# Altium project projeto_ana_exmachina.PrjPcb
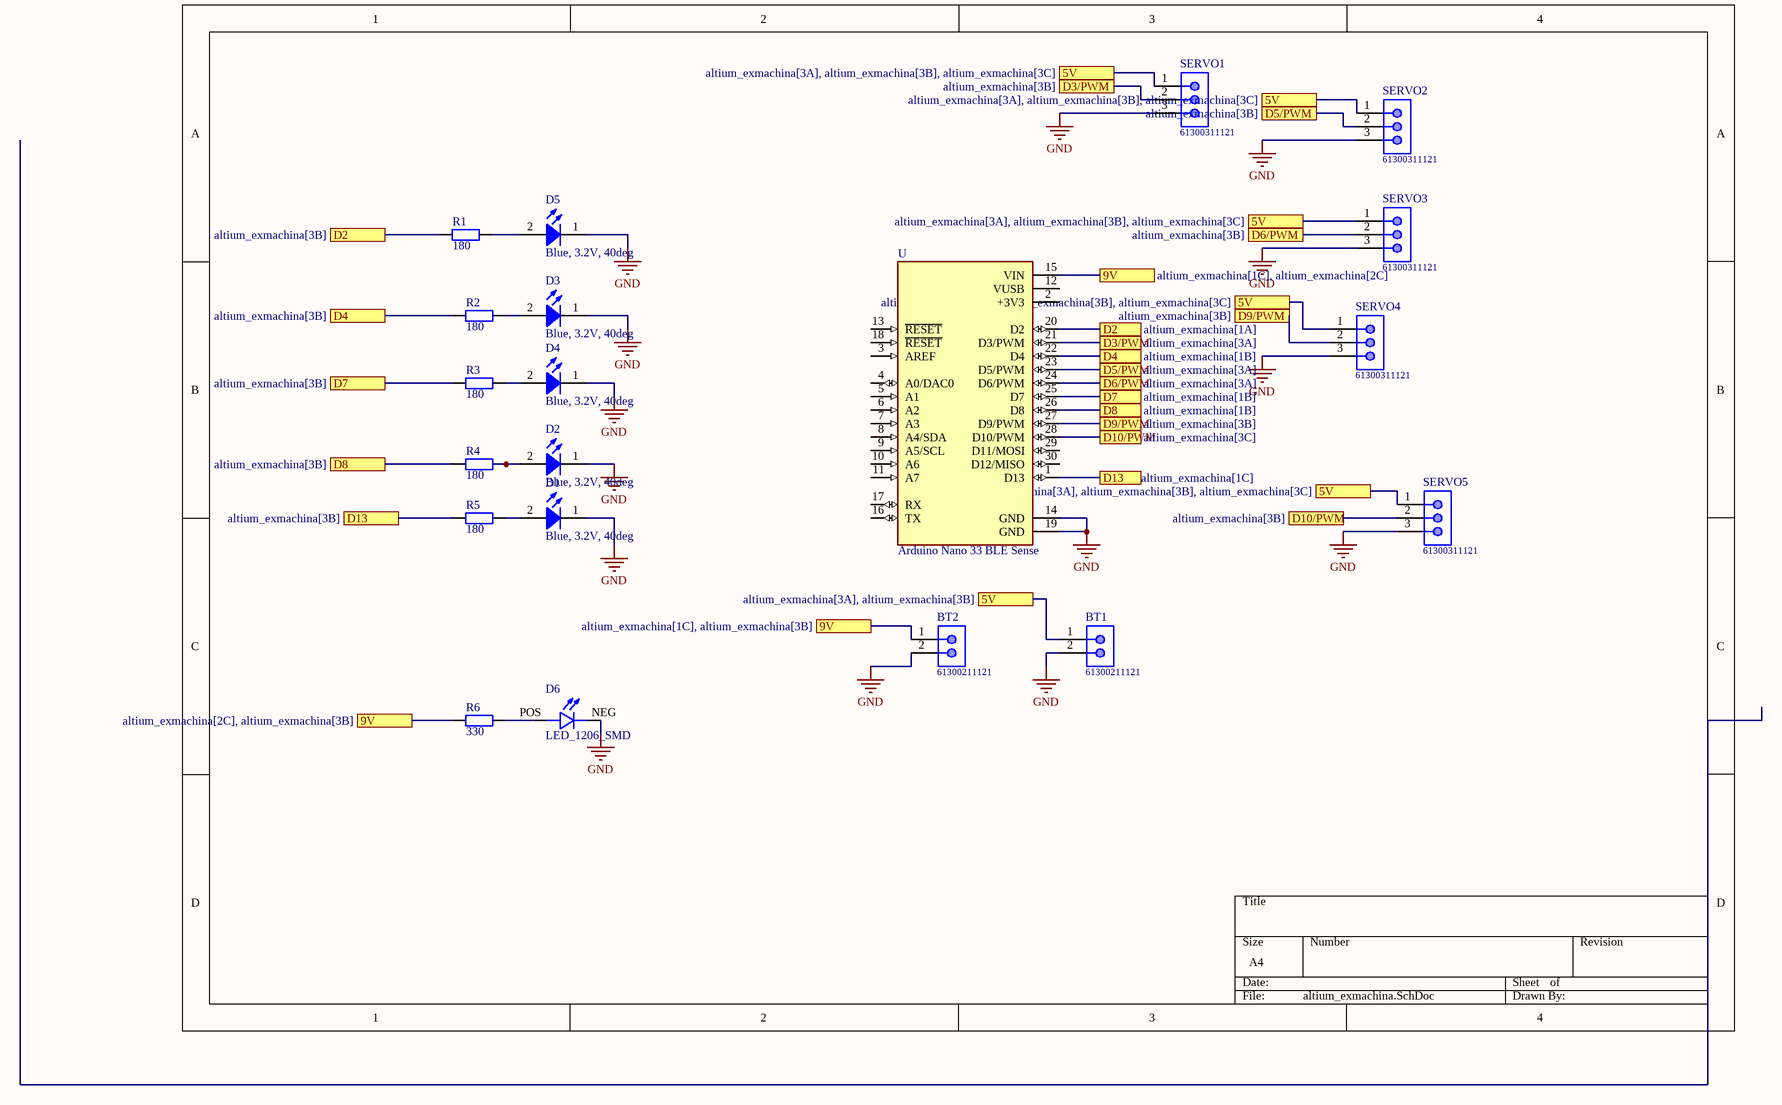
[diagram p0: altium_exmachina.SchDoc]
1 sheet, 20 parts. Net scope: flat (ports and power ports of the same name join across sheets).
Board file: pcbaltium_exmachina.PcbDoc

## Sheet altium_exmachina.SchDoc
size A4; SheetNumber: 1; SheetTotal: 1

### Parts
BT1  61300211121  [61300211121]
BT2  61300211121  [61300211121]
D1  Blue, 3.2V, 40deg  [LED Blue 3mm]
D2  Blue, 3.2V, 40deg  [LED Blue 3mm]
D3  Blue, 3.2V, 40deg  [LED Blue 3mm]
D4  Blue, 3.2V, 40deg  [LED Blue 3mm]
D5  Blue, 3.2V, 40deg  [LED Blue 3mm]
D6  LED_1206_SMD  [LEDC3216X120N]
R1  value 180  [RES AXIAL-0.4]  (hidden comment: Res)
R2  value 180  [RES AXIAL-0.4]  (hidden comment: Res)
R3  value 180  [RES AXIAL-0.4]  (hidden comment: Res)
R4  value 180  [RES AXIAL-0.4]  (hidden comment: Res)
R5  value 180  [RES AXIAL-0.4]  (hidden comment: Res)
R6  value 330  [RES AXIAL-0.4]  (hidden comment: Res)
SERVO1  61300311121  [61300311121]
SERVO2  61300311121  [61300311121]
SERVO3  61300311121  [61300311121]
SERVO4  61300311121  [61300311121]
SERVO5  61300311121  [61300311121]
U  Arduino Nano 33 BLE Sense  [MODULE_ABX00027]

### Ports
5V (see altium_exmachina[3A], altium_exmachina[3B]), 5V (see altium_exmachina[3A], altium_exmachina[3B], altium_exmachina[3C]), 9V (see altium_exmachina[1C], altium_exmachina[2C]), 9V (see altium_exmachina[1C], altium_exmachina[3B]), 9V (see altium_exmachina[2C], altium_exmachina[3B]), D2 (see altium_exmachina[1A]), D2 (see altium_exmachina[3B]), D3/PWM (see altium_exmachina[3A]), D3/PWM (see altium_exmachina[3B]), D4 (see altium_exmachina[1B]), D4 (see altium_exmachina[3B]), D5/PWM (see altium_exmachina[3A]), D5/PWM (see altium_exmachina[3B]), D6/PWM (see altium_exmachina[3A]), D6/PWM (see altium_exmachina[3B]), D7 (see altium_exmachina[1B]), D7 (see altium_exmachina[3B]), D8 (see altium_exmachina[1B]), D8 (see altium_exmachina[3B]), D9/PWM (see altium_exmachina[3B]), D10/PWM (see altium_exmachina[3B]), D10/PWM (see altium_exmachina[3C]), D13 (see altium_exmachina[1C]), D13 (see altium_exmachina[3B])

### Nets
GND: BT1.2 BT2.2 D1.1(K) D2.1(K) D3.1(K) D4.1(K) D5.1(K) D6.NEG SERVO1.3 SERVO2.3 SERVO3.3 SERVO4.3 SERVO5.3 U.14(GND) U.19(GND)
NetBT1_1: BT1.1 SERVO1.1 SERVO2.1 SERVO3.1 SERVO4.1 SERVO5.1 ; port 5V
NetBT2_1: BT2.1 R6.1 U.15(VIN) ; port 9V
NetD1_2: D1.2(A) R5.2
NetD2_2: D2.2(A) R4.2
NetD3_2: D3.2(A) R2.2
NetD4_2: D4.2(A) R3.2
NetD5_2: D5.2(A) R1.2
NetD6_POS: D6.POS R6.2
NetR1_1: R1.1 U.20(D2) ; port D2
NetR2_1: R2.1 U.22(D4) ; port D4
NetR3_1: R3.1 U.25(D7) ; port D7
NetR4_1: R4.1 U.26(D8) ; port D8
NetR5_1: R5.1 U.1(D13) ; port D13
NetSERVO1_2: SERVO1.2 U.21(D3/PWM) ; port D3/PWM
NetSERVO2_2: SERVO2.2 U.23(D5/PWM) ; port D5/PWM
NetSERVO3_2: SERVO3.2 U.24(D6/PWM) ; port D6/PWM
NetSERVO4_2: SERVO4.2 U.27(D9/PWM) ; port D9/PWM
NetSERVO5_2: SERVO5.2 U.28(D10/PWM) ; port D10/PWM

Not connected (* = marked no-connect by the designer): U 2(+3V3) 3(AREF) 4(A0/DAC0) 5(A1) 6(A2) 7(A3) 8(A4/SDA) 9(A5/SCL) 10(A6) 11(A7) 12(VUSB) 13(~{RESET}) 16(TX) 17(RX) 18(~{RESET}) 29(D11/MOSI) 30(D12/MISO)

### Library data of the parts
BT1 BT2 = 61300211121: WR-PHD Pin Header, THT, pitch 2.54mm, Single Row, Vertical, 2pin; Pin Number: 2; Gender: Male; Rated Current: 3A; Working Voltage: 250VAC; Withstanding Voltage: 500VAC; Contact Resistance: 20mOhm; ComponentLink1Description: Manufacturer; ComponentLink1URL: http://www.we-online.de; ComponentLink2Description: Datasheet; ComponentLink2URL: https://katalog.we-online.de/em/datasheet/6130xx11121.pdf; Part Number: 61300211121; Published Date: June 2019; Publisher: Wurth Elektronik; Pitch: 2.54mm; Operating Temperature: -40 to +105degC; Mounting Technology: THT; Packaging: Bag; Row Number: Single; Orientation: Vertical
D1-D5 = LED: LED WL-TMRC THT Mono-color Round; Part Number: 151051BS04000; Luminous Intensity: 500mcd; Dominant Wavelength: 470nm; Peak Wavelength: 465nm; Chip Technology: GaN; ComponentLink1Description: Manufacturer; ComponentLink1URL: http://www.we-online.de; ComponentLink2Description: Datasheet; ComponentLink2URL: https://katalog.we-online.de/led/datasheet/151051BS04000.pdf; Emitting Color: Blue; Operating Temperature: -40 to +85degC; Mounting Technology: THT; Forward Voltage: 3.2V; Packaging: Bulk; Published Date: October 2019; Publisher: Wurth Elektronik; Size: 5mm; Viewing Angle: 40deg
D6 = LED_1206_SMD: 2.6 V Red LED SMD; MP: LHN974 RED LED 1206; MF: Osram; SnapEDA_Link: https://www.snapeda.com/parts/LHN974%20RED%20LED%201206/Osram/view-part/7899607/?ref=snap; Availability: Not in stock; Price: None; Check_prices: https://www.snapeda.com/parts/LHN974%20RED%20LED%201206/Osram/view-part/7899607/?ref=eda; Value: *; Package: None
R1-R6 = Res: Resistor; Published: 8-Jun-2000; LatestRevisionDate: 17-Jul-2002; LatestRevisionNote: Re-released for DXP Platform.; PackageReference: AXIAL-0.4; Publisher: Altium Limited; PackageDescription: Axial Device, Thru-Hole; 2 Leads; 0.4 in Pin Spacing
SERVO1-SERVO5 = 61300311121: WR-PHD Pin Header, THT, pitch 2.54mm, Single Row, Vertical, 3pin; Pin Number: 3; Gender: Male; Rated Current: 3A; Working Voltage: 250VAC; Withstanding Voltage: 500VAC; Contact Resistance: 20mOhm; ComponentLink1Description: Manufacturer; ComponentLink1URL: http://www.we-online.de; ComponentLink2Description: Datasheet; ComponentLink2URL: https://katalog.we-online.de/em/datasheet/6130xx11121.pdf; Part Number: 61300311121; Published Date: June 2019; Publisher: Wurth Elektronik; Pitch: 2.54mm; Operating Temperature: -40 to +105degC; Mounting Technology: THT; Packaging: Bag; Row Number: Single; Orientation: Vertical
U = Arduino Nano 33 BLE Sense: ATSAMD21G18A Arduino Nano 33 IoT SAM D ARMÂ® CortexÂ®-M0 + MCU Ù‡ÛŒØ¦Øª Ù…Ø¯ÛŒØ±Ù‡ Ø§Ø±Ø²ÛŒØ§Ø¨ÛŒ Ø¬Ø§Ø³Ø§Ø²ÛŒ Ø´Ø¯Ù‡ 32 Ø¨ÛŒØªÛŒ; MP: ABX00027; Package: None; Availability: Unavailable; SnapEDA_Link: https://www.snapeda.com/parts/ABX00027/Arduino/view-part/3949339/?ref=snap; DigiKey-Purchase-URL: https://snapeda.com/shop?store=DigiKey&id=3949339; Value: *; MF: Arduino; Price: None; Mouser-Purchase-URL: https://snapeda.com/shop?store=Mouser&id=3949339